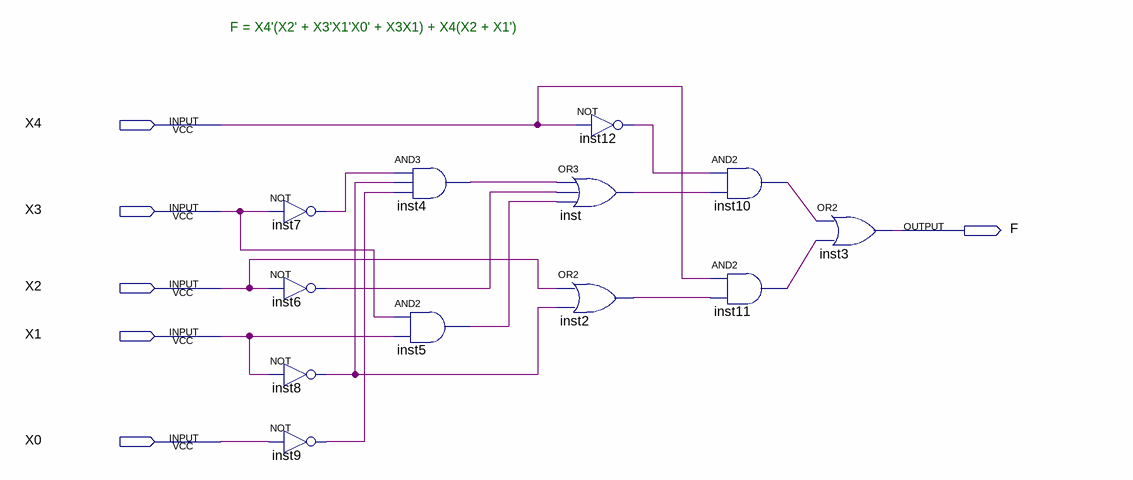
[diagram p0: schematic sheet]
// Quartus schematic Question2.bdf as structural Verilog: 12 symbols, 6 pins
module Question2 (
  input  X4,
  input  X3,
  input  X2,
  input  X1,
  input  X0,
  output F
);

  wire inst2_out, inst4_out, inst5_out, inst6_out, inst7_out, inst8_out, inst9_out, inst10_out, inst11_out,
       inst12_out, inst_out;

  not inst7 (inst7_out, X3);
  not inst6 (inst6_out, X2);
  not inst8 (inst8_out, X1);
  not inst9 (inst9_out, X0);
  and inst4 (inst4_out, inst7_out, inst8_out, inst9_out);
  and inst5 (inst5_out, X3, X1);
  not inst12 (inst12_out, X4);
  or inst (inst_out, inst4_out, inst6_out, inst5_out);
  or inst2 (inst2_out, X2, inst8_out);
  and inst10 (inst10_out, inst12_out, inst_out);
  and inst11 (inst11_out, X4, inst2_out);
  or inst3 (F, inst10_out, inst11_out);

  // Notes on the sheet:
  //   F = X4'(X2' + X3'X1'X0' + X3X1) + X4(X2 + X1')                      
endmodule
